# Altium schematic sheet Connector-Section.SchDoc
size A4; SheetNumber: 12; SheetTotal: 12
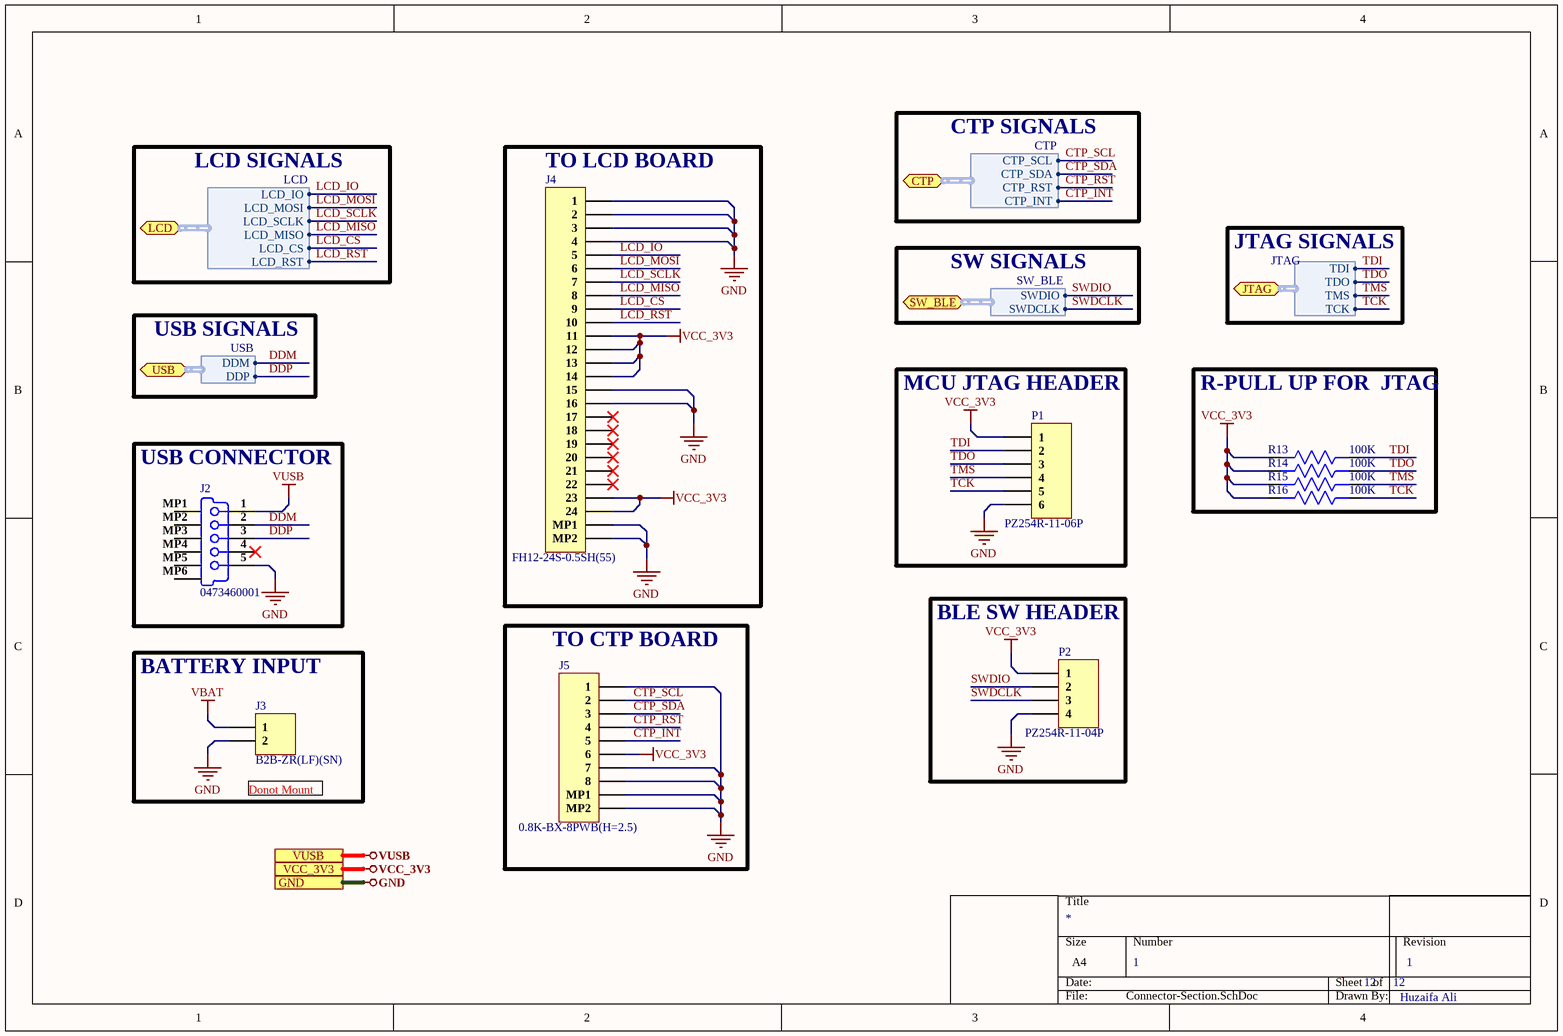
[diagram p0: Connector-Section.SchDoc]

## Parts
J2  0473460001  [0473460001]
J3  B2B-ZR(LF)(SN)  [B2B-ZR(LF)(SN)]
J4  FH12-24S-0.5SH(55)  [FH12-24S-0.5SH(55)]
J5  0.8K-BX-8PWB(H=2.5)  [0.8K-BX-8PWB(H=2.5)]
P1  PZ254R-11-06P  [HDR1X6]
P2  PZ254R-11-04P  [HDR1X4]
R13  100K  [Res0402]
R14  100K  [Res0402]
R15  100K  [Res0402]
R16  100K  [Res0402]

## Blocks framed on the sheet
TO LCD BOARD: J4
MCU JTAG HEADER: P1
R-PULL UP FOR  JTAG: R13-R16
USB CONNECTOR: J2
TO CTP BOARD: J5
BLE SW HEADER: P2
BATTERY INPUT: J3

## Ports
CTP (bidir, harness CTP), GND, JTAG (bidir, harness JTAG), LCD (bidir, harness LCD), SW_BLE (bidir, harness SW_BLE), USB (bidir, harness USB), VCC_3V3, VUSB

## Harnesses
SW_BLE: SWDIO, SWDCLK
USB: DDM, DDP
JTAG: TDI, TDO, TMS, TCK
CTP: CTP_SCL, CTP_SDA, CTP_RST, CTP_INT
LCD: LCD_IO, LCD_MOSI, LCD_SCLK, LCD_MISO, LCD_CS, LCD_RST

## Nets
GND: J2.5(GND) J3.2 J4.1 J4.2 J4.3 J4.4 J4.15 J4.16 J4.MP1 J4.MP2 J5.1 J5.7 J5.8 J5.MP1 J5.MP2 P1.6 P2.4 ; port GND
VBAT: J3.1
VCC_3V3: J4.11 J4.12 J4.13 J4.14 J4.23 J4.24 J5.6 P1.1 P2.1 R13.2 R14.2 R15.2 R16.2 ; port VCC_3V3
VUSB: J2.1(V_BUS_(5V)) ; port VUSB
CTP_INT: J5.5 ; port CTP.CTP_INT
CTP_RST: J5.4 ; port CTP.CTP_RST
CTP_SCL: J5.2 ; port CTP.CTP_SCL
CTP_SDA: J5.3 ; port CTP.CTP_SDA
DDM: J2.2(D-) ; port USB.DDM
DDP: J2.3(D+) ; port USB.DDP
LCD_CS: J4.9 ; port LCD.LCD_CS
LCD_IO: J4.5 ; port LCD.LCD_IO
LCD_MISO: J4.8 ; port LCD.LCD_MISO
LCD_MOSI: J4.6 ; port LCD.LCD_MOSI
LCD_RST: J4.10 ; port LCD.LCD_RST
LCD_SCLK: J4.7 ; port LCD.LCD_SCLK
SWDCLK: P2.3 ; port SW_BLE.SWDCLK
SWDIO: P2.2 ; port SW_BLE.SWDIO
TCK: P1.5 R16.1 ; port JTAG.TCK
TDI: P1.2 R13.1 ; port JTAG.TDI
TDO: P1.3 R14.1 ; port JTAG.TDO
TMS: P1.4 R15.1 ; port JTAG.TMS

Not connected (* = marked no-connect by the designer): J2 4(ID)* MP1(Tab) MP2(Tab) MP3(Tab) MP4(Tab) MP5(Tab) MP6(Tab); J4 17* 18* 19* 20* 21* 22*

## Notes on the sheet
- LCD SIGNALS
- CTP SIGNALS
- JTAG SIGNALS
- SW SIGNALS
- USB SIGNALS
- (near J3) Donot Mount
- 1
- Huzaifa Ali

## Library data of the parts
J2 = 0473460001: Micro-USB B Receptacle with Flange, Bottom Mount, Surface Mount, Lead-Free; Manufacturer: Molex; Manufacturer Part Number: 47346-0001; Supplier 1: Digi-Key; RoHS: Yes; Category: Headers and Wire Housings; Stock 1: 9395; Pricing 1: 1=1.10000, 10=0.91200, 100=0.75980, 1000=0.60782 (USD); ComponentLink1URL: https://datasheet.ciiva.com/30075/304740473460001-io-nectors-30075527.pdf?src-supplier=Onlinecomponents.com; ComponentLink1Description: https://datasheet.ciiva.com/30075/304740473460001-io-nectors-30075527.pdf?src-supplier=Onlinecomponents.com; ComponentLink2URL: https://datasheet.ciiva.com/22654/1630785-22654942.pdf?src-supplier=Element14; ComponentLink2Description: https://datasheet.ciiva.com/22654/1630785-22654942.pdf?src-supplier=Element14; ComponentLink3URL: https://datasheet.ciiva.com/16148/1700180473460001-io-nectors-16148917.pdf?src-supplier=Onlinecomponents.com; ComponentLink3Description: https://datasheet.ciiva.com/16148/1700180473460001-io-nectors-16148917.pdf?src-supplier=Onlinecomponents.com; ComponentLink4URL: https://datasheet.ciiva.com/11731/0900766b80dfe0a7-11731298.pdf?src-supplier=RSComponents; ComponentLink4Description: https://datasheet.ciiva.com/11731/0900766b80dfe0a7-11731298.pdf?src-supplier=RSComponents; ComponentLink5URL: https://datasheet.ciiva.com/1098/1698067-1098476.pdf?src-supplier=Element14; ComponentLink5Description: https://datasheet.ciiva.com/1098/1698067-1098476.pdf?src-supplier=Element14; ComponentLink6URL: https://datasheet.ciiva.com/4598/0473460001-io-connectors-146446-4598841.pdf?src-supplier=Mouser; ComponentLink6Description: https://datasheet.ciiva.com/4598/0473460001-io-connectors-146446-4598841.pdf?src-supplier=Mouser; ComponentLink7URL: https://datasheet.ciiva.com/28504/0473460001-io-connectors-28504587.pdf?src-supplier=Element14; ComponentLink7Description: https://datasheet.ciiva.com/28504/0473460001-io-connectors-28504587.pdf?src-supplier=Element14; ComponentLink8URL: https://datasheet.ciiva.com/46390/1681853-46390956.pdf?src-supplier=Element14; ComponentLink8Description: https://datasheet.ciiva.com/46390/1681853-46390956.pdf?src-supplier=Element14; ComponentLink9URL: https://datasheet.ciiva.com/16986/70266948-16986683.pdf?src-supplier=Allied+Electronics; ComponentLink9Description: https://datasheet.ciiva.com/16986/70266948-16986683.pdf?src-supplier=Allied+Electronics; Supplier Part Number 1: WM17141DKR-ND
J3 = B2B-ZR(LF)(SN): CONN HEADER VERT 2POS 1.5MM; Manufacturer: JST; Body Plating: Tin; Number of Positions: 2; Contact Resistance: 30mR; Max Current Rating: 1A; Max Voltage Rating (AC): 50V; Gender: Male; Insulation Resistance: 500MR; Panel Thickness: 3.5mm; Supplier 1: Digi-Key; Manufacturer Part Number: B2B-ZR(LF)(SN); RoHS: Yes; Category: Board to Board Connectors; Stock 1: 113095; Pricing 1: 1=0.17000, 10=0.13500, 100=0.09990, 500=0.08270, 1000=0.07237, 5000=0.06203, 10000=0.06031 (USD); Mount: Through Hole; Contact Plating: Copper,Tin; Color: White; Contact Material: Brass,Copper,Tin; Housing Color: Beige; Housing Material: Polyamide; Material: Nylon; Contact Shape: Circular; Insulation Material: Nylon; Insulation Color: Natural; Contact Finish - Mating: TIN; Min Operating Temperature: -25°C; Max Operating Temperature: 85°C; Number of Rows: 1; Packaging: Bulk; Connector Type: Header; Termination: Solder; Current Rating: 1A; Orientation: Straight; Fastening Type: Detent; Number of Contacts: 2; Series: ZH; Contact Type: Male Pin; Voltage Rating: 50V; Voltage Rating (AC): 50V; Voltage Rating (DC): 50V; Length: 4.5mm; Pitch: 1.5mm; Depth: 3.5mm; Lead Pitch: 1.5mm; Contact Mating Length: 0.094inch; Lead Free: Lead Free; REACH SVHC: No SVHC; Flammability Rating: UL94 V-0; ComponentLink1URL: https://datasheet.ciiva.com/11752/0900766b8082f580-11752167.pdf?src-supplier=RSComponents; ComponentLink1Description: https://datasheet.ciiva.com/11752/0900766b8082f580-11752167.pdf?src-supplier=RSComponents; ComponentLink2URL: https://datasheet.ciiva.com/25616/0900766b81147f94-25616906.pdf?src-supplier=RSComponents; ComponentLink2Description: https://datasheet.ciiva.com/25616/0900766b81147f94-25616906.pdf?src-supplier=RSComponents; ComponentLink3URL: https://datasheet.ciiva.com/26894/getdatasheetpartid-643133-26894438.pdf?src-supplier=Verical; ComponentLink3Description: https://datasheet.ciiva.com/26894/getdatasheetpartid-643133-26894438.pdf?src-supplier=Verical; ComponentLink4URL: https://datasheet.ciiva.com/712/ezh-712443.pdf?src-supplier=Digi-Key; ComponentLink4Description: https://datasheet.ciiva.com/712/ezh-712443.pdf?src-supplier=Digi-Key; ComponentLink5URL: https://datasheet.ciiva.com/8052/80551-8052026.pdf?src-supplier=Element14; ComponentLink5Description: https://datasheet.ciiva.com/8052/80551-8052026.pdf?src-supplier=Element14; Supplier Part Number 1: 455-1657-ND
J4 = FH12-24S-0.5SH(55): CONN FFC BOTTOM 24POS 0.50MM R/A; Manufacturer: Hirose; Supplier 1: RSComponents; Manufacturer Part Number: FH12-24S-0.5SH(55); RoHS: Yes; Category: FFC / FPC; Stock 1: 30; Pricing 1: 5=0.91700, 100=0.76200, 375=0.63900, 1500=0.59600, 3000=0.55300 (USD); ComponentLink1URL: https://datasheet.ciiva.com/15176/getdatasheetpartid-439675-15176853.pdf?src-supplier=Verical; ComponentLink1Description: https://datasheet.ciiva.com/15176/getdatasheetpartid-439675-15176853.pdf?src-supplier=Verical; ComponentLink2URL: https://datasheet.ciiva.com/22630/58803-22630351.pdf?src-supplier=Farnell; ComponentLink2Description: https://datasheet.ciiva.com/22630/58803-22630351.pdf?src-supplier=Farnell; ComponentLink3URL: https://datasheet.ciiva.com/5137/ed-fh12-20140305-355586-5137161.pdf?src-supplier=Mouser; ComponentLink3Description: https://datasheet.ciiva.com/5137/ed-fh12-20140305-355586-5137161.pdf?src-supplier=Mouser; ComponentLink4URL: https://datasheet.ciiva.com/22697/58803-22697094.pdf?src-supplier=Element14; ComponentLink4Description: https://datasheet.ciiva.com/22697/58803-22697094.pdf?src-supplier=Element14; ComponentLink5URL: https://datasheet.ciiva.com/7661/58803-7661382.pdf?src-supplier=Element14; ComponentLink5Description: https://datasheet.ciiva.com/7661/58803-7661382.pdf?src-supplier=Element14; Supplier Part Number 1: 7388827
J5 = 0.8K-BX-8PWB(H=2.5): Slide Lock -20℃~+85℃ 8 Bottom Contact Surface Mount 0.8mm SMD,P=0.8mm FFC/FPC Connectors ROHS; Manufacturer: HDGC; Manufacturer Part Number: 0.8K-BX-8PWB(H=2.5); Footprint: Custom; ComponentLink1Description: LCSC; ComponentLink1URL: https://lcsc.com/product-detail/FFC-FPC-Connectors_HDGC-0-8K-BX-8PWB-H-2-5_C2915436.html
P1 = PZ254R-11-06P: Header，Breakaway 6 Shrouded 1 2.54mm Through Hole,P=2.54mm Pin Headers ROHS; Manufacturer: XFCN; Value: 6-PIN; Manufacturer Part No: PZ254R-11-06P; Package: THROUGH HOLE 2.54MM; ComponentLink1Description: LCSC; ComponentLink1URL: https://lcsc.com/product-detail/Pin-Headers_MINTRON-MTP125-1105S1_C358687.html
P2 = PZ254R-11-04P: Header，Breakaway 4 Shrouded 1 2.54mm Through Hole,P=2.54mm Pin Headers ROHS; Manufacturer: XFCN; Manufacturer Part No: PZ254-11-04P; Value: 4-PIN; Package: THROUGH HOLE 2.54MM; ComponentLink1Description: LCSC; ComponentLink1URL: https://lcsc.com/product-detail/Pin-Headers_MINTRON-MTP125-1104S1_C358686.html
R13-R16 = ERJPA2F1003X: RES SMD 100K OHM 1% 1/5W 0402; Manufacturer: Panasonic; Manufacturer Part Number: ERJ-PA2F1003X; Resistance: 100kR; Power Rating: 200mW; Voltage Rating: 50V; Temperature Coefficient: 100ppm/°C; Supplier 1: Digi-Key; Stock 1: 8829; Pricing 1: 1=0.21, 10=0.175, 100=0.0686, 1000=0.02871, 2500=0.02632, 5000=0.02393 (USD); Case/Package: 0402; Case Code (Metric): 1005; Case Code (Imperial): 0402; Min Operating Temperature: -55°C; Max Operating Temperature: 155°C; Packaging: Cut Tape; Composition: Thick Film; Number of Terminations: 2; Tolerance: 1%; Max Power Dissipation: 200mW; Voltage Rating (DC): 50V; Features: Automotive AEC-Q200; Length: 0.039inch; Height: 0.016inch; Width: 0.02inch; REACH SVHC: Unknown; ComponentLink1URL: http://www.farnell.com/datasheets/2051174.pdf?src-supplier=Element14; ComponentLink1Description: http://www.farnell.com/datasheets/2051174.pdf?src-supplier=Element14; ComponentLink2URL: https://industrial.panasonic.com/ww/system/files/data/download/catalog/id_fixed-resistors_e_1.pdf?src-supplier=Digi-Key; ComponentLink2Description: https://industrial.panasonic.com/ww/system/files/data/download/catalog/id_fixed-resistors_e_1.pdf?src-supplier=Digi-Key; Supplier Part Number 1: P17236CT-ND